# Altium schematic sheet tc264母版核心v5.SchDoc
size A3
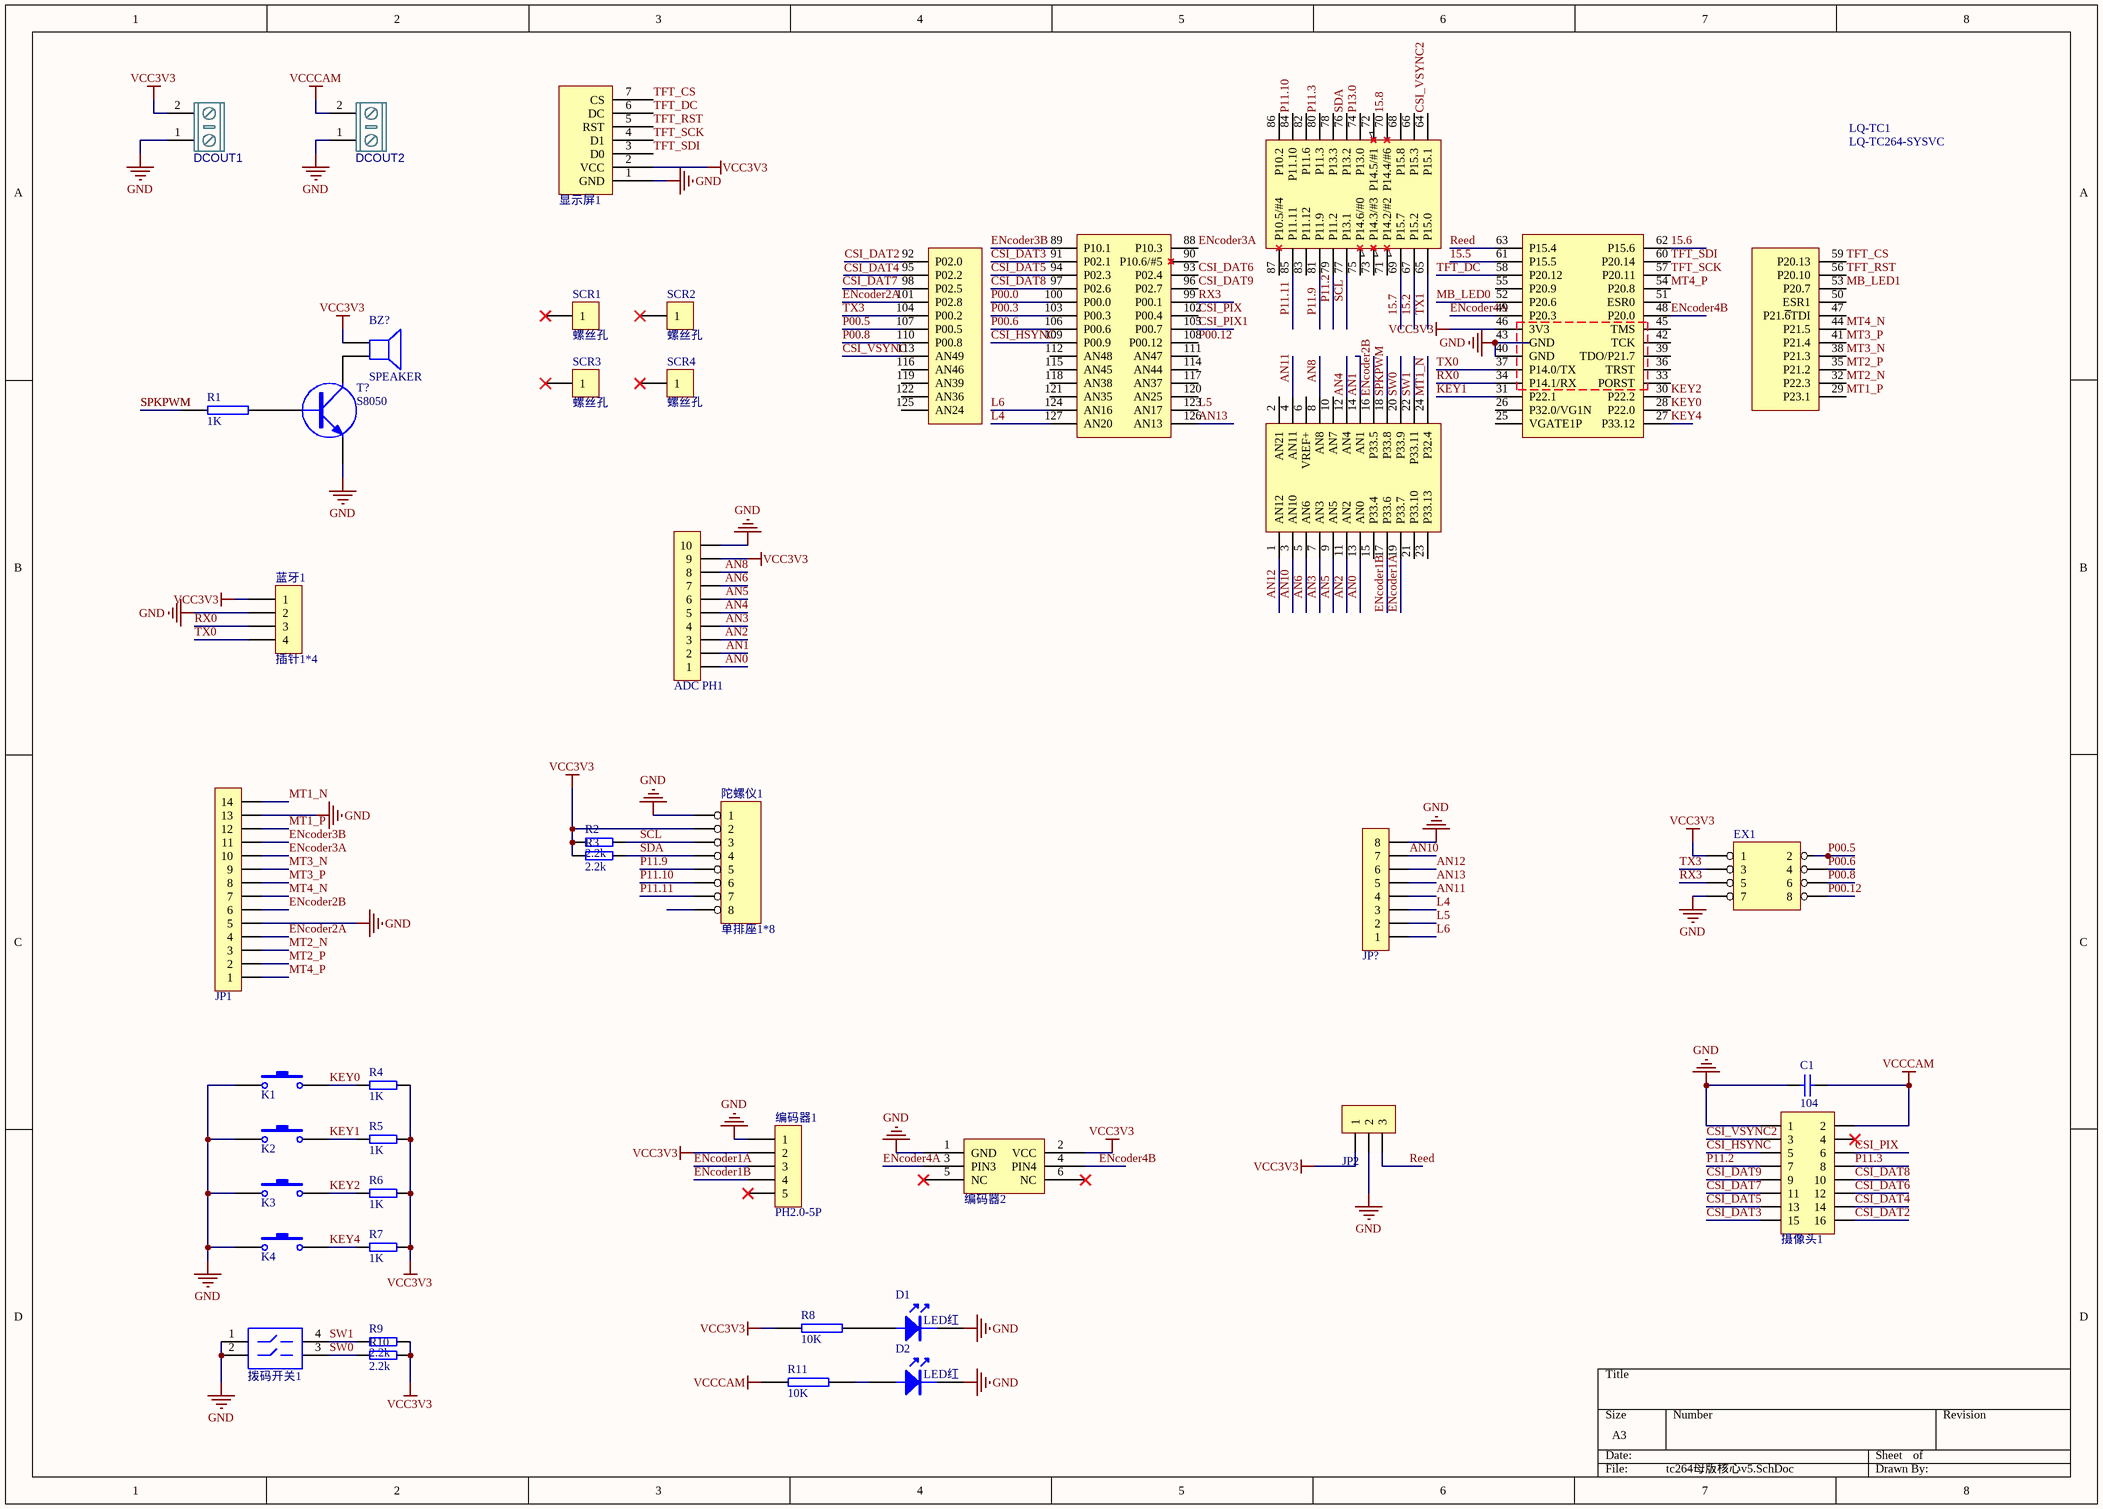
[diagram p0: tc264母版核心v5.SchDoc]

## Parts
ADC_PH1  HDR-1X10  [PH2.0-W-10P]  (value not drawn)
BZ?  SPEAKER  [LQ_BUZZER9]
C1  104  [LQ_C0603]
D1  LED红  [LQ_LED0603R]
D2  LED红  [LQ_LED0603R]
DCOUT1  KF/WJ/DG 30x connecter  [KF/WJ/DG 301-2p-5.0mm]  (value not drawn)
DCOUT2  KF/WJ/DG 30x connecter  [KF/WJ/DG 301-2p-5.0mm]  (value not drawn)
EX1  (no value)  [LQ_IDC4X2]
JP1  HDR-1X14  [XH2.54-LI-14P]  (value not drawn)
JP2  HDR-1X3  [ZH1.5-WI-3P]  (value not drawn)
JP?  HDR-1X8  [ZH1.5-WI-8P]  (value not drawn)
K1  微动开关6*6*6  [LQ_BT4SMT]  (value not drawn)
K2  微动开关6*6*6  [LQ_BT4SMT]  (value not drawn)
K3  微动开关6*6*6  [LQ_BT4SMT]  (value not drawn)
K4  微动开关6*6*6  [LQ_BT4SMT]  (value not drawn)
LQ-TC1  LQ-TC264-SYSVC  [LQ-TC264-SYSVC-S]
R1  1K  [LQ_R0603]
R2  2.2k  [LQ_R0603]
R3  2.2k  [LQ_R0603]
R4  1K  [LQ_R0603]
R5  1K  [LQ_R0603]
R6  1K  [LQ_R0603]
R7  1K  [LQ_R0603]
R8  10K  [LQ_R0603]
R9  2.2k  [LQ_R0603]
R10  2.2k  [LQ_R0603]
R11  10K  [LQ_R0603]
SCR1  螺丝孔  [LQ_SCROW3&5mm]
SCR2  螺丝孔  [LQ_SCROW3&5mm]
SCR3  螺丝孔  [LQ_SCROW3&5mm]
SCR4  螺丝孔  [LQ_SCROW3&5mm]
T?  S8050  [LQ_SOT-23NPN]
拨码开关1  SW-DIP2  [DIP4]  (value not drawn)
摄像头1  Header 8X2  [HDR2.54-LI-2x8P]  (value not drawn)
显示屏1  单排座1*7-2.54  [LQ-TFT-180V33]  (value not drawn)
编码器1  PH2.0-5P  [PH2.0-Wi-5P]
编码器2  双排针3X2  [LQ_ENCODER]  (value not drawn)
蓝牙1  插针1*4  [HDR2.54-LI-4P]
陀螺仪1  单排座1*8  [HDR1X8]

## Nets
GND: ADC_PH1.10 C1.1 D1.2 D2.2 DCOUT1.1 DCOUT2.1 EX1.7 JP1.5 JP1.13 JP2.2 JP?.8 K1.1 K2.1 K3.1 K4.1 LQ-TC1.40(GND) LQ-TC1.43(GND) T?.3(E) 拨码开关1.1 拨码开关1.2 摄像头1.1 显示屏1.1(GND) 编码器1.1 编码器2.1(GND) 蓝牙1.2 陀螺仪1.1
VCC3V3: ADC_PH1.9 BZ?.1 DCOUT1.2 EX1.1 JP2.1 LQ-TC1.46(3V3) R2.1 R3.1 R4.2 R5.2 R6.2 R7.2 R8.1 R9.2 R10.2 显示屏1.2(VCC) 编码器1.2 编码器2.2(VCC) 蓝牙1.1 陀螺仪1.2
VCCCAM: C1.2 DCOUT2.2 R11.1 摄像头1.2
15.2: LQ-TC1.67(P15.2)
15.5: LQ-TC1.61(P15.5)
15.6: LQ-TC1.62(P15.6)
15.7: LQ-TC1.69(P15.7)
15.8: LQ-TC1.70(P14.4/#6)
AN0: ADC_PH1.1 LQ-TC1.13(AN0)
AN1: ADC_PH1.2 LQ-TC1.14(AN1)
AN2: ADC_PH1.3 LQ-TC1.11(AN2)
AN3: ADC_PH1.4 LQ-TC1.7(AN3)
AN4: ADC_PH1.5 LQ-TC1.12(AN4)
AN5: ADC_PH1.6 LQ-TC1.9(AN5)
AN6: ADC_PH1.7 LQ-TC1.5(AN6)
AN8: ADC_PH1.8 LQ-TC1.8(AN8)
AN10: JP?.7 LQ-TC1.3(AN10)
AN11: JP?.4 LQ-TC1.4(AN11)
AN12: JP?.6 LQ-TC1.1(AN12)
AN13: JP?.5 LQ-TC1.126(AN13)
CSI_DAT2: LQ-TC1.92(P02.0) 摄像头1.16
CSI_DAT3: LQ-TC1.91(P02.1) 摄像头1.15
CSI_DAT4: LQ-TC1.95(P02.2) 摄像头1.14
CSI_DAT5: LQ-TC1.94(P02.3) 摄像头1.13
CSI_DAT6: LQ-TC1.93(P02.4) 摄像头1.12
CSI_DAT7: LQ-TC1.98(P02.5) 摄像头1.11
CSI_DAT8: LQ-TC1.97(P02.6) 摄像头1.10
CSI_DAT9: LQ-TC1.96(P02.7) 摄像头1.9
CSI_HSYNC: LQ-TC1.109(P00.9) 摄像头1.5
CSI_PIX: LQ-TC1.102(P00.4) 摄像头1.6
CSI_PIX1: LQ-TC1.105(P00.7)
CSI_VSYNC: LQ-TC1.113(AN49)
CSI_VSYNC2: LQ-TC1.64(P15.1) 摄像头1.3
ENcoder1A: LQ-TC1.19(P33.7) 编码器1.3
ENcoder1B: LQ-TC1.17(P33.6) 编码器1.4
ENcoder2A: JP1.4 LQ-TC1.101(P02.8)
ENcoder2B: JP1.6 LQ-TC1.16(P33.5)
ENcoder3A: JP1.10 LQ-TC1.88(P10.3)
ENcoder3B: JP1.11 LQ-TC1.89(P10.1)
ENcoder4A: LQ-TC1.49(P20.3) 编码器2.3(PIN3)
ENcoder4B: LQ-TC1.48(P20.0) 编码器2.4(PIN4)
KEY0: K1.2 LQ-TC1.28(P22.0) R4.1
KEY1: K2.2 LQ-TC1.31(P22.1) R5.1
KEY2: K3.2 LQ-TC1.30(P22.2) R6.1
KEY4: K4.2 LQ-TC1.27(P33.12) R7.1
L4: JP?.3 LQ-TC1.127(AN20)
L5: JP?.2 LQ-TC1.123(AN17)
L6: JP?.1 LQ-TC1.124(AN16)
MB_LED0: LQ-TC1.52(P20.6)
MB_LED1: LQ-TC1.53(P20.7)
MT1_N: JP1.14 LQ-TC1.24(P32.4)
MT1_P: JP1.12 LQ-TC1.29(P23.1)
MT2_N: JP1.3 LQ-TC1.32(P22.3)
MT2_P: JP1.2 LQ-TC1.35(P21.2)
MT3_N: JP1.9 LQ-TC1.38(P21.3)
MT3_P: JP1.8 LQ-TC1.41(P21.4)
MT4_N: JP1.7 LQ-TC1.44(P21.5)
MT4_P: JP1.1 LQ-TC1.54(P20.8)
P00.0: LQ-TC1.100(P00.0)
P00.3: LQ-TC1.103(P00.3)
P00.5: EX1.2 LQ-TC1.107(P00.5)
P00.6: EX1.4 LQ-TC1.106(P00.6)
P00.8: EX1.6 LQ-TC1.110(P00.8)
P00.12: EX1.8 LQ-TC1.108(P00.12)
P11.2: LQ-TC1.79(P11.2) 摄像头1.7
P11.3: LQ-TC1.80(P11.3) 摄像头1.8
P11.9: LQ-TC1.81(P11.9) 陀螺仪1.5
P11.10: LQ-TC1.84(P11.10) 陀螺仪1.6
P11.11: LQ-TC1.85(P11.11) 陀螺仪1.7
P13.0: LQ-TC1.74(P13.0)
Reed: JP2.3 LQ-TC1.63(P15.4)
RX0: LQ-TC1.34(P14.1/RX) 蓝牙1.3
RX3: EX1.5 LQ-TC1.99(P00.1)
SCL: LQ-TC1.77(P13.1) R2.2 陀螺仪1.3
SDA: LQ-TC1.76(P13.2) R3.2 陀螺仪1.4
SPKPWM: LQ-TC1.18(P33.8) R1.1
SW0: LQ-TC1.20(P33.9) R10.1 拨码开关1.3
SW1: LQ-TC1.22(P33.11) R9.1 拨码开关1.4
TFT_CS: LQ-TC1.59(P20.13) 显示屏1.7(CS)
TFT_DC: LQ-TC1.58(P20.12) 显示屏1.6(DC)
TFT_RST: LQ-TC1.56(P20.10) 显示屏1.5(RST)
TFT_SCK: LQ-TC1.57(P20.11) 显示屏1.4(D1)
TFT_SDI: LQ-TC1.60(P20.14) 显示屏1.3(D0)
TX0: LQ-TC1.37(P14.0/TX) 蓝牙1.4
TX1: LQ-TC1.65(P15.0)
TX3: EX1.3 LQ-TC1.104(P00.2)
NetBZ?_2: BZ?.2 T?.2(C)
NetD1_1: D1.1 R8.2
NetD2_1: D2.1 R11.2
NetR1_2: R1.2 T?.1(B)

Not connected (* = marked no-connect by the designer): LQ-TC1 2(AN21) 6(VREF+) 10(AN7) 15(P33.4) 21(P33.10) 23(P33.13) 25(VGATE1P) 26(P32.0/VG1N) 33(PORST) 36(TRST) 39(TDO/P21.7) 42(TCK) 45(TMS) 47(P21.~{6}TDI) 50(ESR1) 51(ESR0) 55(P20.9) 66(P15.3) 68(P15.8) 71(P14.2/#2) 72(P14.5/#1) 73(P14.3/#3) 75(P14.6/#0) 78(P13.3) 82(P11.6) 83(P11.12) 86(P10.2) 87(P10.5/#4) 90(P10.6/#5) 111(AN47) 112(AN48) 114(AN44) 115(AN45) 116(AN46) 117(AN37) 118(AN38) 119(AN39) 120(AN25) 121(AN35) 122(AN36) 125(AN24); SCR1 1*; SCR2 1*; SCR3 1*; SCR4 1*; 摄像头1 4*; 编码器1 5*; 编码器2 5(NC)* 6(NC)*; 陀螺仪1 8

## Library data of the parts
ADC_PH1 = Header 10: 10P接插件; 以赠品形式获赠本封装库的买家，还可联系卖家免费指导AD软件使用: 联系卖家 免费技术支持; 联系卖家，免费查找封装: 唯一出售店铺网址https://shop463601444.taobao.com
C1 = Cap: Capacitor; Published: 8-Jun-2000; LatestRevisionDate: 17-Jul-2002; LatestRevisionNote: Re-released for DXP Platform.; PackageReference: RAD-0.3; Publisher: Altium Limited; PackageDescription: Radial Cap, Thru-Hole; 2 Leads; 0.3 in Pin Spacing; Value: 104
D1 D2 = LED
DCOUT1 DCOUT2 = KF/WJ/DG 30x: 接线端子 2Pin
EX1 = HEADER 4X2
JP1 = Header 14: 14P接插件; 联系卖家，免费查找封装: 唯一出售店铺网址https://shop463601444.taobao.com; 封装库来自淘宝卖家ID：黄晶宝石: 其他店铺购入均为盗版封装库，请立即申请退款，本店现金奖励50~200元; BOM名称: 14P接插件
JP2 = Header 3: 3P接插件; 联系卖家，免费查找封装: 唯一出售店铺网址https://shop463601444.taobao.com; BOM名称: 3P接插件
JP? = Header 8: 8P接插件; 联系卖家，免费查找封装: 唯一出售店铺网址https://shop463601444.taobao.com; BOM名称: 8P接插件
K1-K4 = 微动开关
R1 R8 R11 = RES2
R2-R7 R9 R10 = LQ_RES: RES
SCR1-SCR4 = CON1: Connector
T? = NPN: NPN Transistor
摄像头1 = Header 8X2: 8*2P接插件; 联系卖家，免费查找封装: 唯一出售店铺网址https://shop463601444.taobao.com; 封装库来自淘宝卖家ID：黄晶宝石: 其他店铺购入均为盗版封装库，请立即申请退款，本店现金奖励50~200元; BOM名称: 8*2P接插件
显示屏1 = LQ_OLED128X64
编码器1 = CON5: Connector
编码器2 = Component_1_1
蓝牙1 = CON4: Connector
陀螺仪1 = 8 HEADER: 8 Pin Header